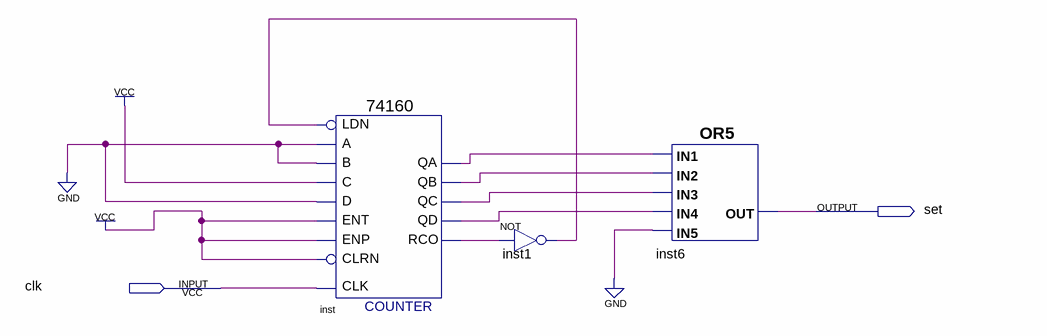
[diagram p0: schematic sheet]
// Quartus schematic set0.bdf as structural Verilog: 3 symbols, 2 pins
module set0 (
  input  clk,
  output set
);

  wire inst1_out, inst_qa, inst_qb, inst_qc, inst_qd, inst_rco;

  \74160  inst (
    .CLK(clk), .ENT(1'b1), .A(1'b0), .B(1'b0), .C(1'b1), .D(1'b0), .LDN(inst1_out), .ENP(1'b1), .CLRN(1'b1),
    .QD(inst_qd), .QA(inst_qa), .QB(inst_qb), .QC(inst_qc), .RCO(inst_rco));
  not inst1 (inst1_out, inst_rco);
  or inst6 (set, inst_qa, inst_qb, inst_qc, inst_qd, 1'b0);
endmodule
